# Altium schematic sheet 1700-0002_InterfaceBoard_RevA_1.SchDoc: 1700-0002_InterfaceBoard_RevA
size 897 x 589 mm; DRAWING_DATE: 4/15/2022; DRAWING_TITLE: PQI380 UNIV. INTERFACE BRD; PART_NUMBER: 7000-0303; REV: R12; Origin: Eagle; Date: 7/13/2023 2:16:40 PM; SheetNumber: 2; DWG-CO-NAME: DWG-CO-NAME; DWG-DATE: DWG-DATE; DWG-NUMBER: DWG-NUMBER; DWG-REV: DWG-REV; DWG-TITLE: DWG-TITLE; SIZE: SIZE; GateName_1: G$1; SymbolName_1: FRAME_D_L; LibraryName: frames; DeviceSetName: FRAME_D_L; Sheet: Sheet:
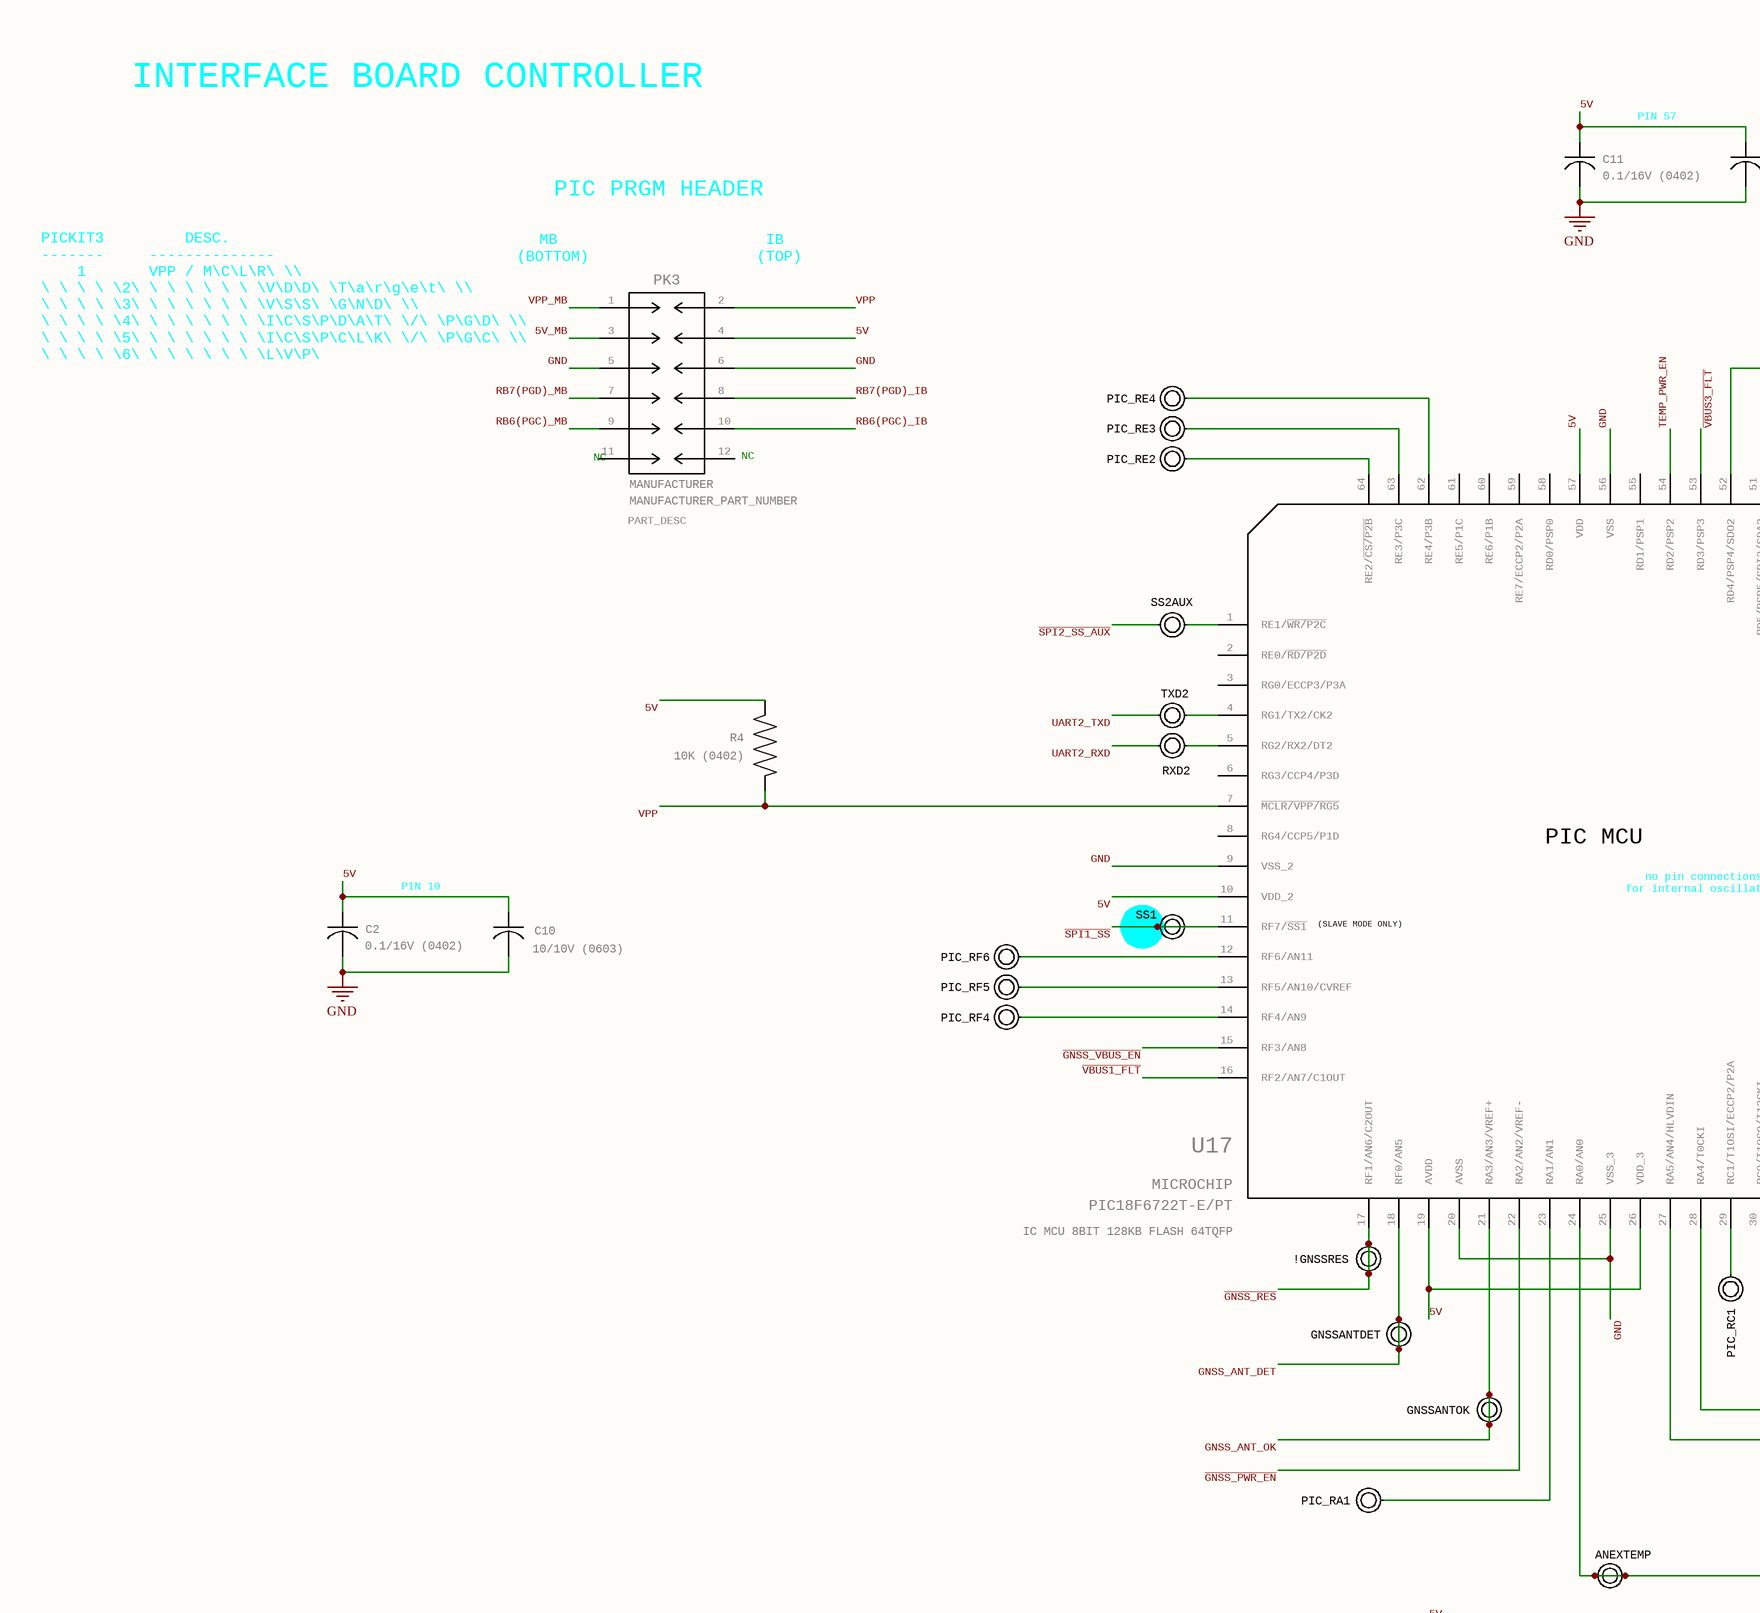
[diagram p0: 1700-0002_InterfaceBoard_RevA_1.SchDoc, top left]
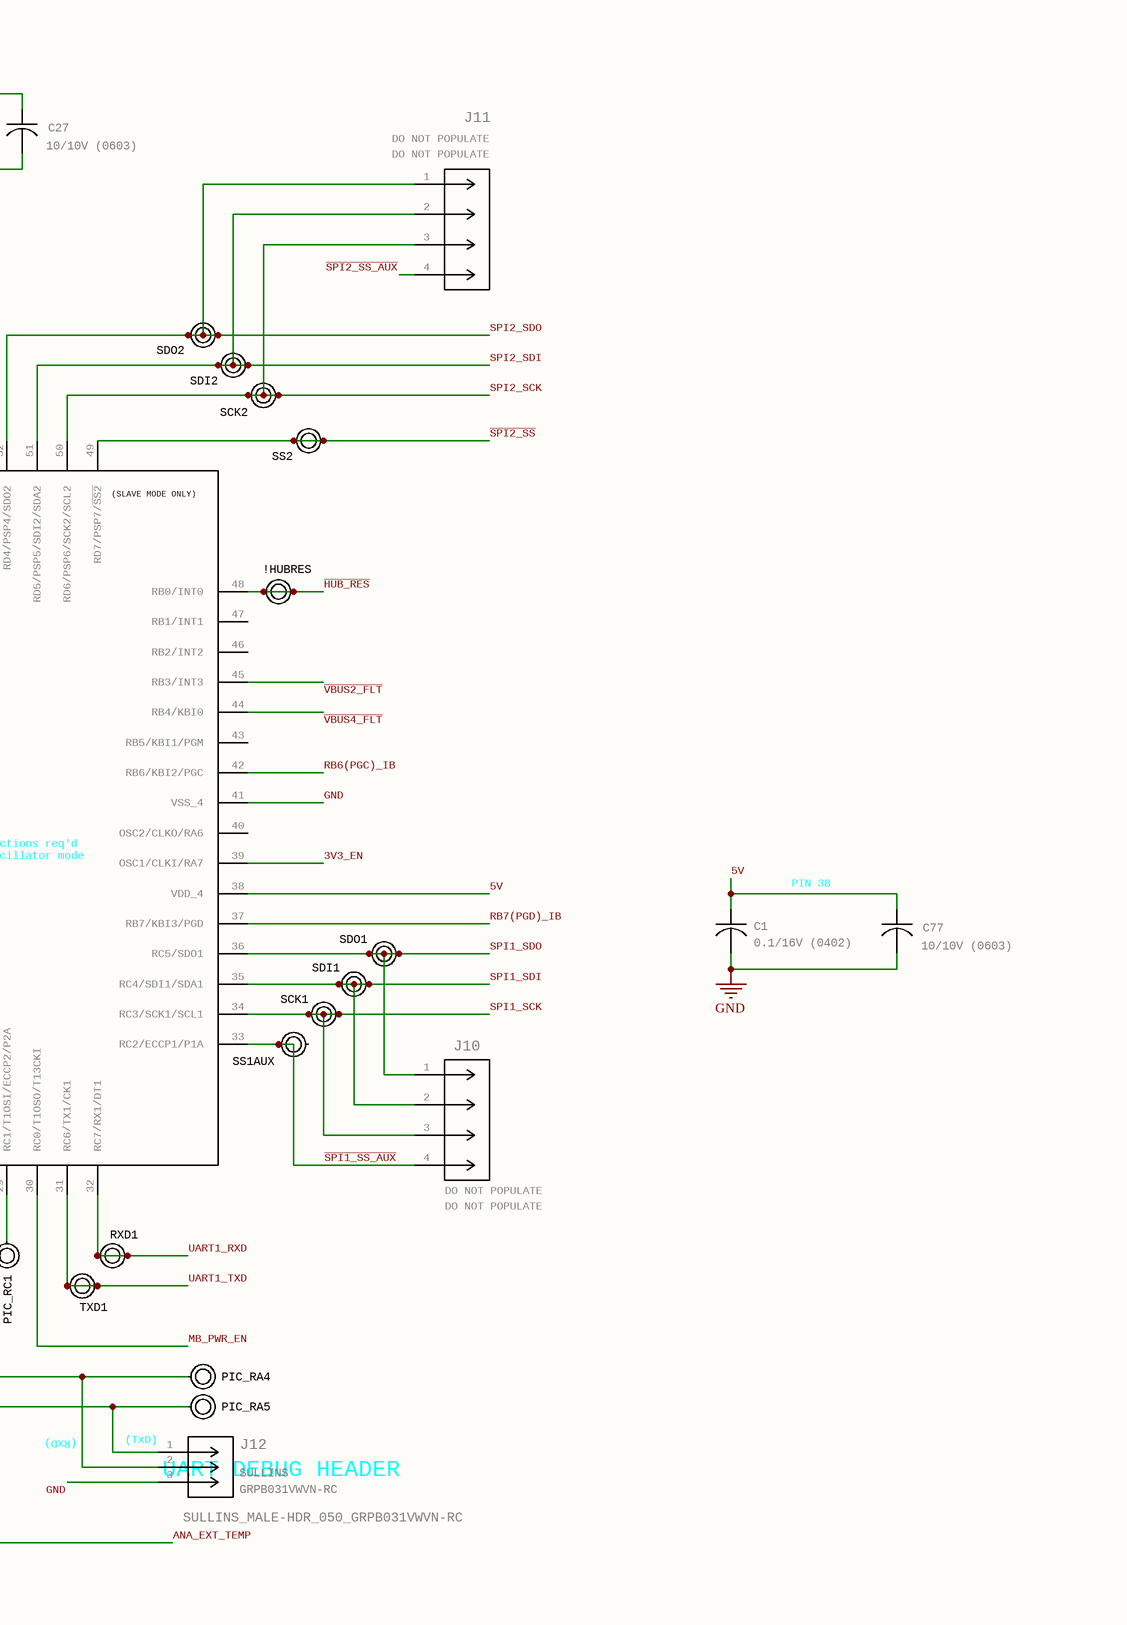
[diagram p1: 1700-0002_InterfaceBoard_RevA_1.SchDoc, top middle]
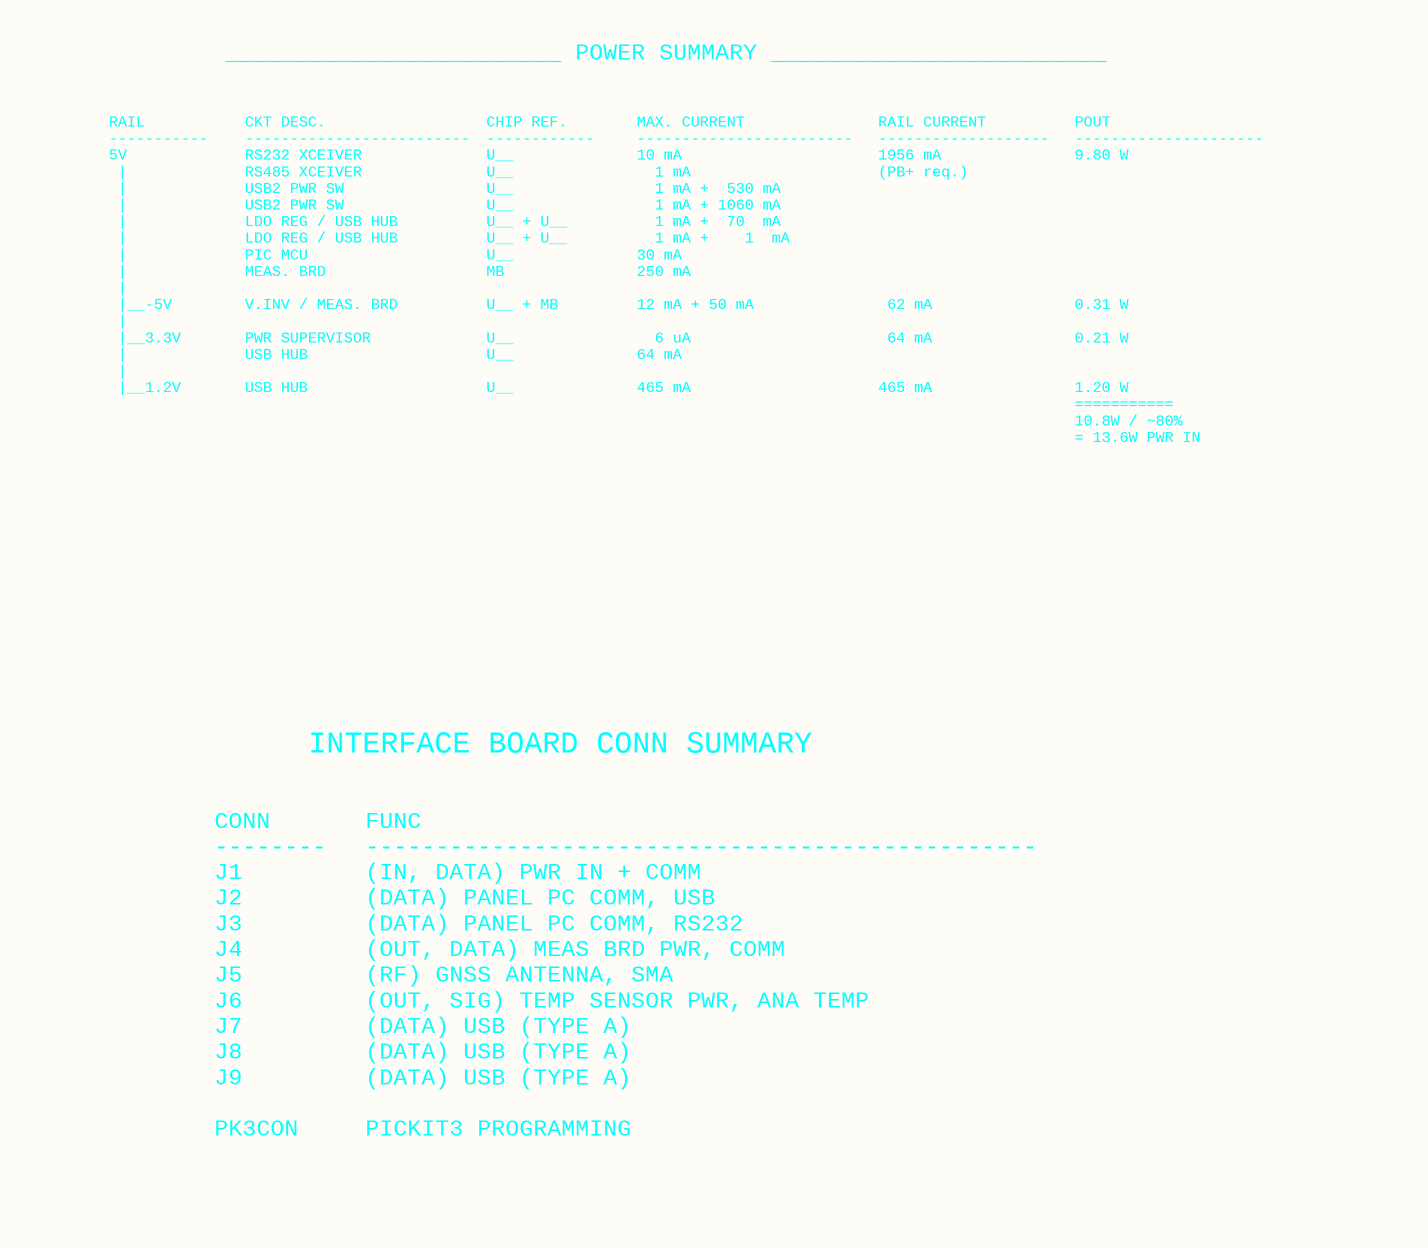
[diagram p2: 1700-0002_InterfaceBoard_RevA_1.SchDoc, top right]
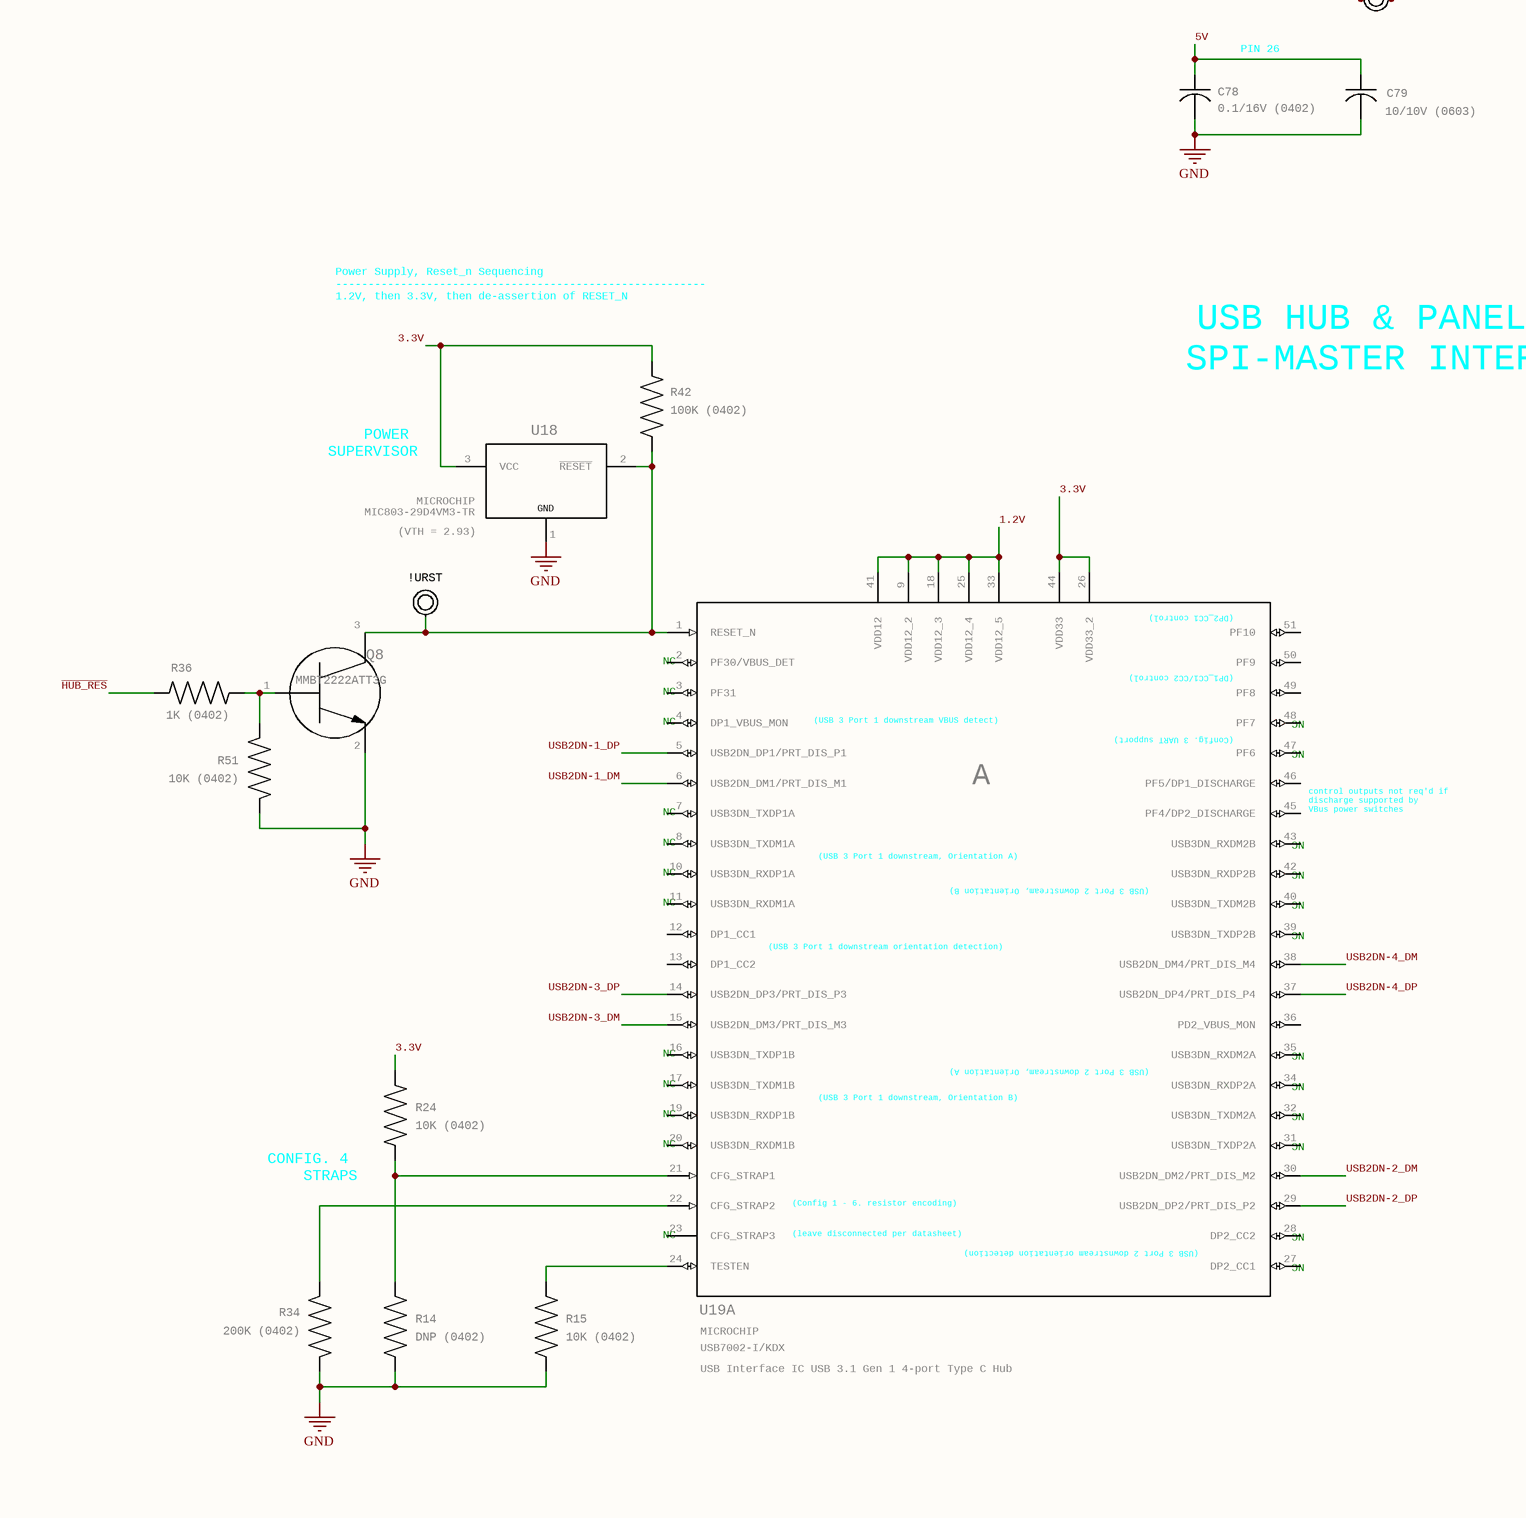
[diagram p3: 1700-0002_InterfaceBoard_RevA_1.SchDoc, bottom left]
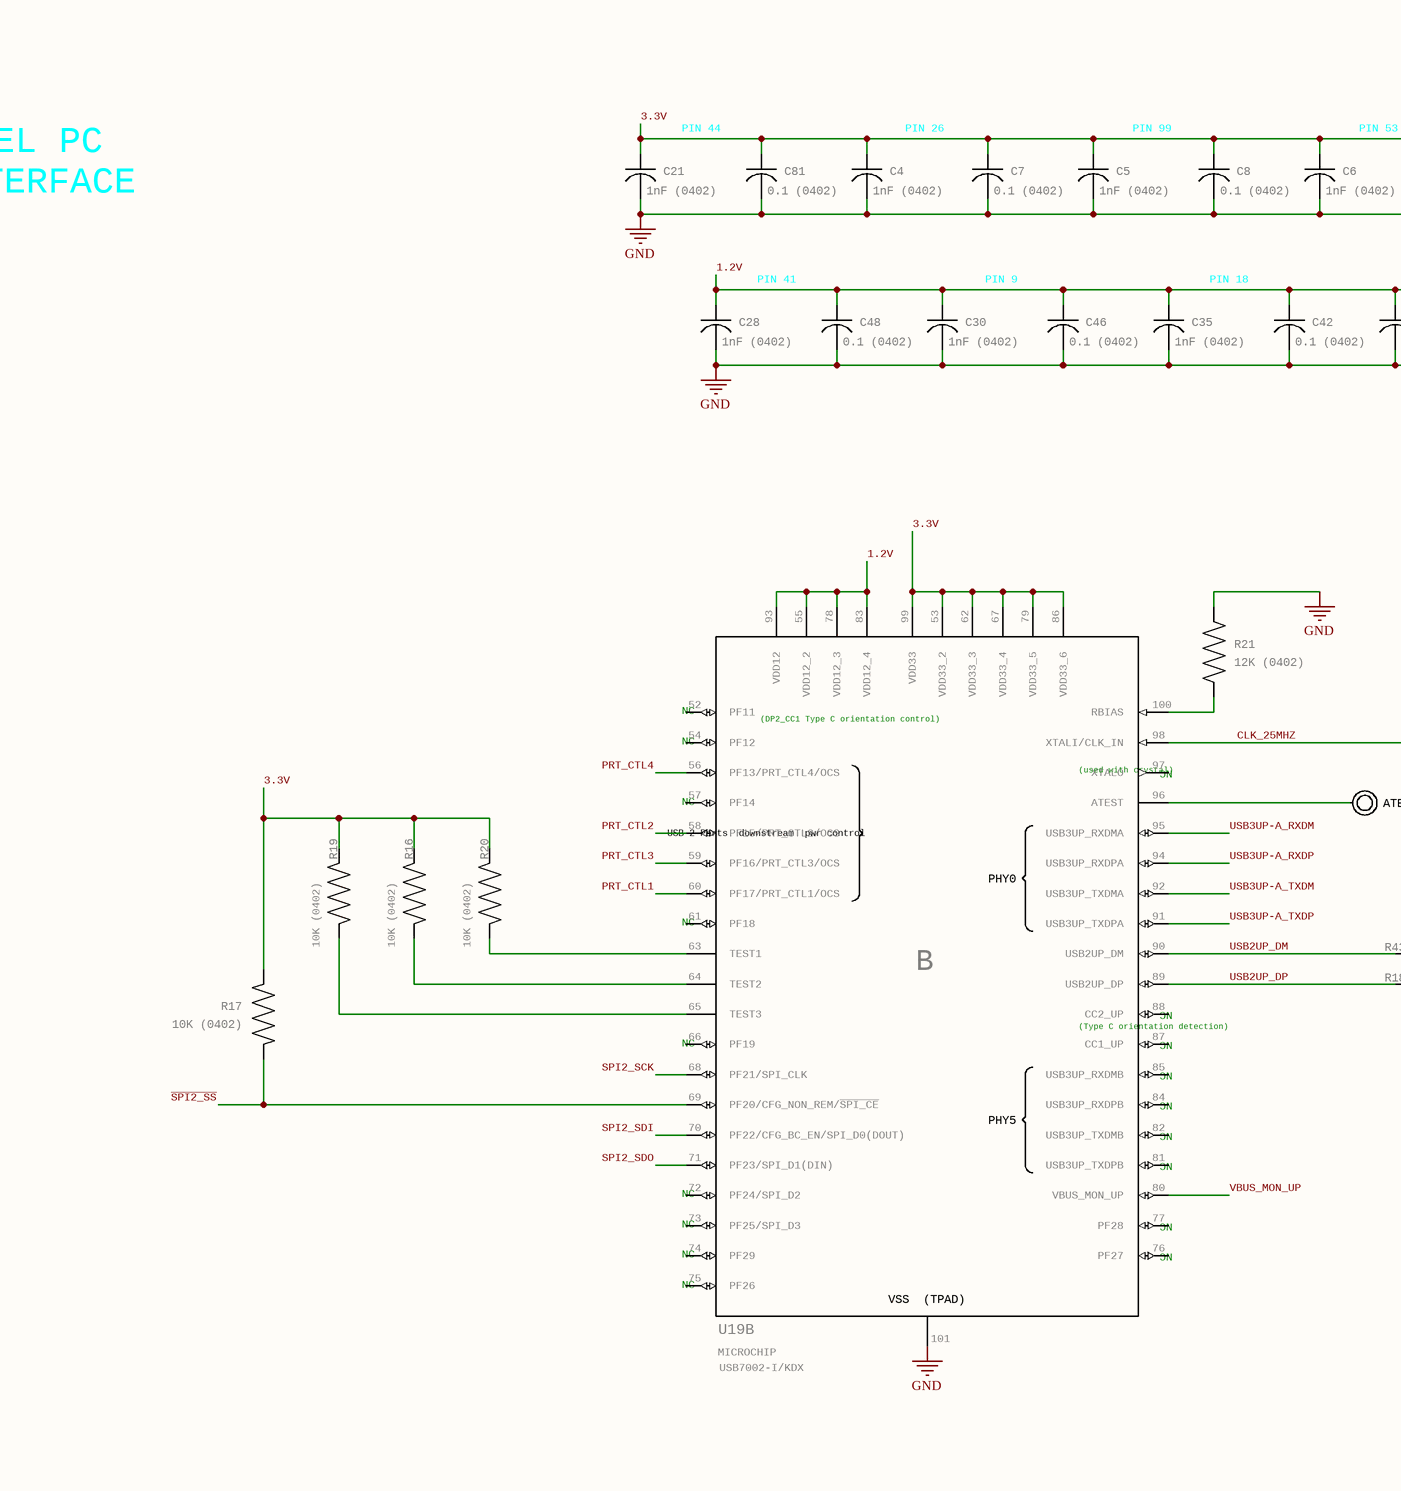
[diagram p4: 1700-0002_InterfaceBoard_RevA_1.SchDoc, bottom middle]
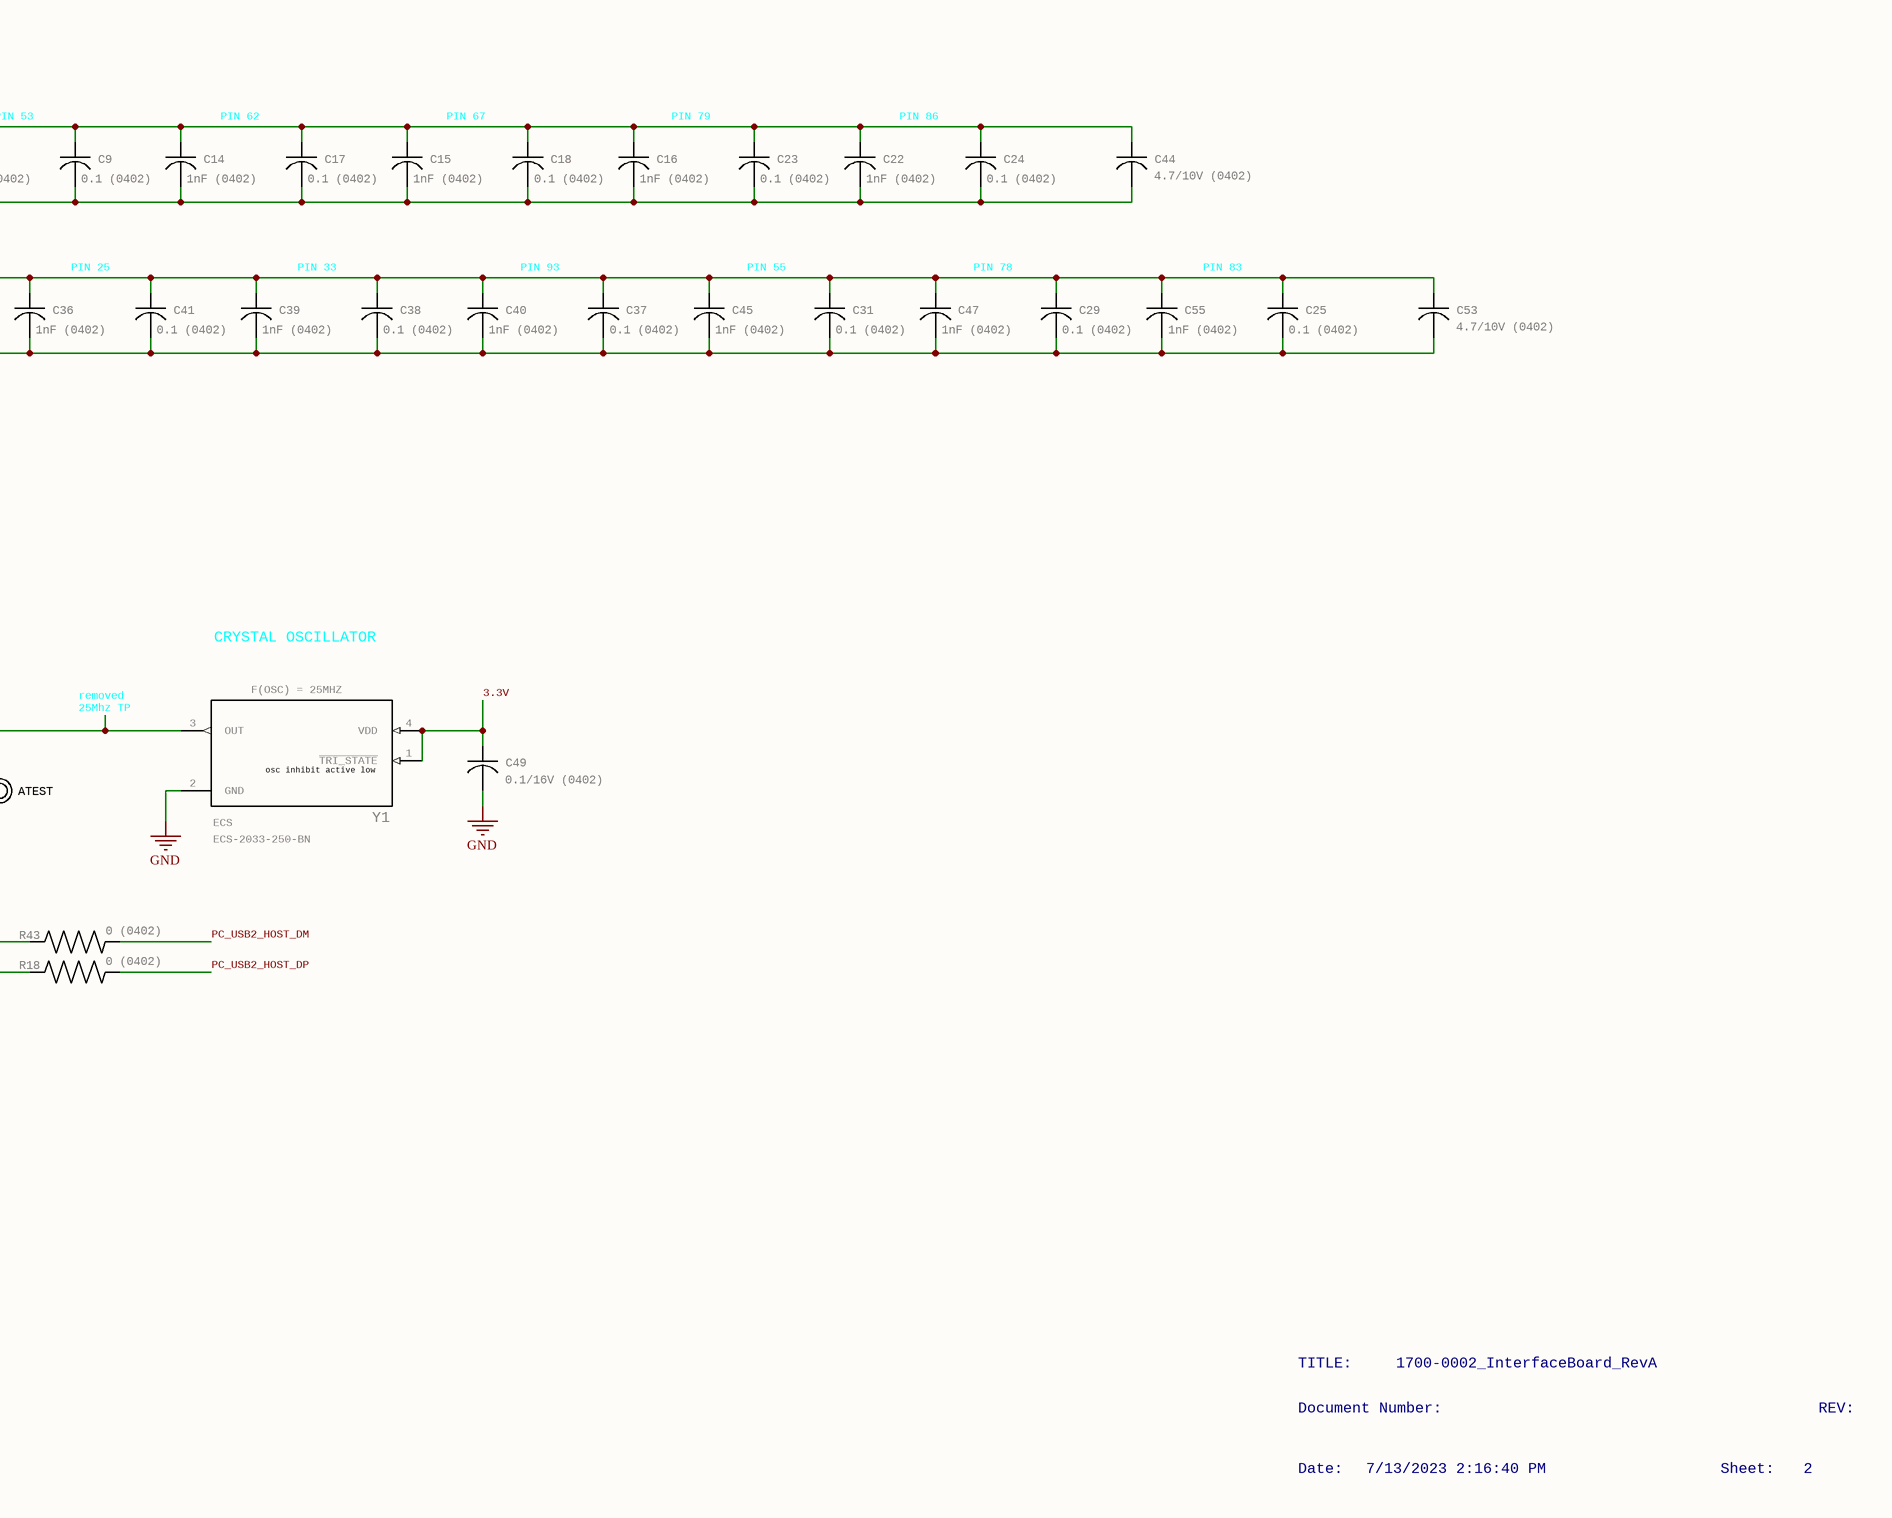
[diagram p5: 1700-0002_InterfaceBoard_RevA_1.SchDoc, bottom right]

## Parts
!GNSSRES  TST_POINT_PTH_20X40MIL_2PIN  [TST_POINT_PTH_20X40MIL_2PIN]  (value not drawn)
!HUBRES  TST_POINT_PTH_20X40MIL_2PIN  [TST_POINT_PTH_20X40MIL_2PIN]  (value not drawn)
!URST  TST_POINT_PTH_042-OCT  [TST_POINT_PTH_042-OCT]  (value not drawn)
ANEXTEMP  TST_POINT_PTH_20X40MIL_2PIN  [TST_POINT_PTH_20X40MIL_2PIN]  (value not drawn)
ATEST  TST_POINT_PTH_042-OCT  [TST_POINT_PTH_042-OCT]  (value not drawn)
C1  0.1/16V (0402)  [G-155_MUR]
C2  0.1/16V (0402)  [G-155_MUR]
C4  1nF (0402)  [G-155_MUR]
C5  1nF (0402)  [G-155_MUR]
C6  1nF (0402)  [G-155_MUR]
C7  0.1 (0402)  [G-155_MUR]
C8  0.1 (0402)  [G-155_MUR]
C9  0.1 (0402)  [G-155_MUR]
C10  10/10V (0603)  [CAP_C1608_TDK]
C11  0.1/16V (0402)  [G-155_MUR]
C14  1nF (0402)  [G-155_MUR]
C15  1nF (0402)  [G-155_MUR]
C16  1nF (0402)  [G-155_MUR]
C17  0.1 (0402)  [G-155_MUR]
C18  0.1 (0402)  [G-155_MUR]
C21  1nF (0402)  [G-155_MUR]
C22  1nF (0402)  [G-155_MUR]
C23  0.1 (0402)  [G-155_MUR]
C24  0.1 (0402)  [G-155_MUR]
C25  0.1 (0402)  [G-155_MUR]
C27  10/10V (0603)  [CAP_C1608_TDK]
C28  1nF (0402)  [G-155_MUR]
C29  0.1 (0402)  [G-155_MUR]
C30  1nF (0402)  [G-155_MUR]
C31  0.1 (0402)  [G-155_MUR]
C35  1nF (0402)  [G-155_MUR]
C36  1nF (0402)  [G-155_MUR]
C37  0.1 (0402)  [G-155_MUR]
C38  0.1 (0402)  [G-155_MUR]
C39  1nF (0402)  [G-155_MUR]
C40  1nF (0402)  [G-155_MUR]
C41  0.1 (0402)  [G-155_MUR]
C42  0.1 (0402)  [G-155_MUR]
C44  4.7/10V (0402)  [G-155_MUR]
C45  1nF (0402)  [G-155_MUR]
C46  0.1 (0402)  [G-155_MUR]
C47  1nF (0402)  [G-155_MUR]
C48  0.1 (0402)  [G-155_MUR]
C49  0.1/16V (0402)  [G-155_MUR]
C53  4.7/10V (0402)  [G-155_MUR]
C55  1nF (0402)  [G-155_MUR]
C77  10/10V (0603)  [CAP_C1608_TDK]
C78  0.1/16V (0402)  [G-155_MUR]
C79  10/10V (0603)  [CAP_C1608_TDK]
C81  0.1 (0402)  [G-155_MUR]
GNSSANTDET  TST_POINT_PTH_20X40MIL_2PIN  [TST_POINT_PTH_20X40MIL_2PIN]  (value not drawn)
GNSSANTOK  TST_POINT_PTH_20X40MIL_2PIN  [TST_POINT_PTH_20X40MIL_2PIN]  (value not drawn)
J10  MANUFACTURER: DO NOT POPULATE  [MOLEX_VERT-HDR_171861004]  (hidden comment: MOLEX_VERT-HDR_1718561004)
J11  MANUFACTURER: DO NOT POPULATE  [MOLEX_VERT-HDR_171861004]  (hidden comment: MOLEX_VERT-HDR_1718561004)
J12  SULLINS_MALE-HDR_050_GRPB031VWVN-RC  MANUFACTURER: SULLINS  MANUFACTURER_PART_NUMBER: GRPB031VWVN-RC  [CONN_GRPB031VWVN-RC_SUL]
PIC_RA1  TST_POINT_PTH_042-OCT  [TST_POINT_PTH_042-OCT]  (value not drawn)
PIC_RA4  TST_POINT_PTH_042-OCT  [TST_POINT_PTH_042-OCT]  (value not drawn)
PIC_RA5  TST_POINT_PTH_042-OCT  [TST_POINT_PTH_042-OCT]  (value not drawn)
PIC_RC1  TST_POINT_PTH_042-OCT  [TST_POINT_PTH_042-OCT]  (value not drawn)
PIC_RE2  TST_POINT_PTH_042-OCT  [TST_POINT_PTH_042-OCT]  (value not drawn)
PIC_RE3  TST_POINT_PTH_042-OCT  [TST_POINT_PTH_042-OCT]  (value not drawn)
PIC_RE4  TST_POINT_PTH_042-OCT  [TST_POINT_PTH_042-OCT]  (value not drawn)
PIC_RF4  TST_POINT_PTH_042-OCT  [TST_POINT_PTH_042-OCT]  (value not drawn)
PIC_RF5  TST_POINT_PTH_042-OCT  [TST_POINT_PTH_042-OCT]  (value not drawn)
PIC_RF6  TST_POINT_PTH_042-OCT  [TST_POINT_PTH_042-OCT]  (value not drawn)
PK3  CON_MOLEX_901311086  [CON_901311086_MOL]  (value not drawn)
Q8  MMBT2222ATT3G  [SC-75(SOT-416)_ONSEMI]
R4  10K (0402)  [RESC1005X35N]
R14  DNP (0402)  [RESC1005X35N]
R15  10K (0402)  [RESC1005X35N]
R16  10K (0402)  [RESC1005X35N]
R17  10K (0402)  [RESC1005X35N]
R18  0 (0402)  [RESC1005X35N]
R19  10K (0402)  [RESC1005X35N]
R20  10K (0402)  [RESC1005X35N]
R21  12K (0402)  [RESC1005X35N]
R24  10K (0402)  [RESC1005X35N]
R34  200K (0402)  [RESC1005X35N]
R36  1K (0402)  [RESC1005X35N]
R42  100K (0402)  [RESC1005X35N]
R43  0 (0402)  [RESC1005X35N]
R51  10K (0402)  [RESC1005X35N]
RXD1  TST_POINT_PTH_20X40MIL_2PIN  [TST_POINT_PTH_20X40MIL_2PIN]  (value not drawn)
RXD2  TST_POINT_PTH_20X40MIL_2PIN  [TST_POINT_PTH_20X40MIL_2PIN]  (value not drawn)
SCK1  TST_POINT_PTH_20X40MIL_2PIN  [TST_POINT_PTH_20X40MIL_2PIN]  (value not drawn)
SCK2  TST_POINT_PTH_20X40MIL_2PIN  [TST_POINT_PTH_20X40MIL_2PIN]  (value not drawn)
SDI1  TST_POINT_PTH_20X40MIL_2PIN  [TST_POINT_PTH_20X40MIL_2PIN]  (value not drawn)
SDI2  TST_POINT_PTH_20X40MIL_2PIN  [TST_POINT_PTH_20X40MIL_2PIN]  (value not drawn)
SDO1  TST_POINT_PTH_20X40MIL_2PIN  [TST_POINT_PTH_20X40MIL_2PIN]  (value not drawn)
SDO2  TST_POINT_PTH_20X40MIL_2PIN  [TST_POINT_PTH_20X40MIL_2PIN]  (value not drawn)
SS1  TST_POINT_PTH_20X40MIL_2PIN  [TST_POINT_PTH_20X40MIL_2PIN]  (value not drawn)
SS1AUX  TST_POINT_PTH_20X40MIL_2PIN  [TST_POINT_PTH_20X40MIL_2PIN]  (value not drawn)
SS2  TST_POINT_PTH_20X40MIL_2PIN  [TST_POINT_PTH_20X40MIL_2PIN]  (value not drawn)
SS2AUX  TST_POINT_PTH_20X40MIL_2PIN  [TST_POINT_PTH_20X40MIL_2PIN]  (value not drawn)
TXD1  TST_POINT_PTH_20X40MIL_2PIN  [TST_POINT_PTH_20X40MIL_2PIN]  (value not drawn)
TXD2  TST_POINT_PTH_20X40MIL_2PIN  [TST_POINT_PTH_20X40MIL_2PIN]  (value not drawn)
U17  PICMCU: PIC MCU  (SLAVEMODEONLY): (SLAVE MODE ONLY)  MANUFACTURER: MICROCHIP  MANUFACTURER_PART_NUMBER: PIC18F6722T-E/PT  PART_DESC: IC MCU 8BIT 128KB FLASH 64TQFP  [TQFP64_10X10MC_MCH]  (hidden comment: PIC18F6627T-E/PT)
U18  (VTH = 2.93)  MANUFACTURER: MICROCHIP  MANUFACTURER_PART_NUMBER: MIC803-29D4VM3-TR  [SOT-23_M3_MCH]
U19  MANUFACTURER: MICROCHIP  MANUFACTURER_PART_NUMBER: USB7002-I/KDX  PART_DESC: USB Interface IC USB 3.1 Gen 1 4-port Type C Hub  [VQFN100_KDX_MCH]  (hidden comment: MICROCHIP_USB7002-I/KDX)  (parts A,B of 2)
Y1  F(OSC) = 25MHZ  oscinhibitactivelow: osc inhibit active low  MANUFACTURER: ECS  MANUFACTURER_PART_NUMBER: ECS-2033-250-BN  [OSC_ECS-2033-250-BN]

## Nets
GND: C1.2 C2.2 C4.2 C5.2 C6.2 C7.2 C8.2 C9.2 C10.2 C11.2 C14.2 C15.2 C16.2 C17.2 C18.2 C21.2 C22.2 C23.2 C24.2 C25.2 C27.2 C28.2 C29.2 C30.2 C31.2 C35.2 C36.2 C37.2 C38.2 C39.2 C40.2 C41.2 C42.2 C44.2 C45.2 C46.2 C47.2 C48.2 C49.2 C53.2 C55.2 C77.2 C78.2 C79.2 C81.2 J12.3 PK3.5 PK3.6 Q8.2(E) R14.2 R15.2 R21.1 R34.2 R51.2 U17.9(VSS_2) U17.20(AVSS) U17.25(VSS_3) U17.41(VSS_4) U17.56(VSS) U18.1(GND) U19.101(VSS) Y1.2(GND)
1.2V: C25.1 C28.1 C29.1 C30.1 C31.1 C35.1 C36.1 C37.1 C38.1 C39.1 C40.1 C41.1 C42.1 C45.1 C46.1 C47.1 C48.1 C53.1 C55.1 U19.9(VDD12_2) U19.18(VDD12_3) U19.25(VDD12_4) U19.33(VDD12_5) U19.41(VDD12) U19.55(VDD12_2) U19.78(VDD12_3) U19.83(VDD12_4) U19.93(VDD12)
3.3V: C4.1 C5.1 C6.1 C7.1 C8.1 C9.1 C14.1 C15.1 C16.1 C17.1 C18.1 C21.1 C22.1 C23.1 C24.1 C44.1 C49.1 C81.1 R16.1 R17.1 R19.1 R20.1 R24.1 R42.1 U18.3(VCC) U19.26(VDD33_2) U19.44(VDD33) U19.53(VDD33_2) U19.62(VDD33_3) U19.67(VDD33_4) U19.79(VDD33_5) U19.86(VDD33_6) U19.99(VDD33) Y1.1(~{TRI_STATE}) Y1.4(VDD)
3V3_EN: U17.39(OSC1/CLKI/RA7)
5V: C1.1 C2.1 C10.1 C11.1 C27.1 C77.1 C78.1 C79.1 PK3.4 R4.1 U17.10(VDD_2) U17.19(AVDD) U17.26(VDD_3) U17.38(VDD_4) U17.57(VDD)
5V_MB: PK3.3
ANA_EXT_TEMP: ANEXTEMP.P$1 ANEXTEMP.P$2 U17.24(RA0/AN0)
CLK_25MHZ: U19.98(XTALI/CLK_IN) Y1.3(OUT)
~{GNSS_PWR_EN}: U17.22(RA2/AN2/VREF-)
~{GNSS_RES}: !GNSSRES.P$1 !GNSSRES.P$2 U17.17(RF1/AN6/C2OUT)
~{GNSS_VBUS_EN}: U17.15(RF3/AN8)
GNSS_ANT_DET: GNSSANTDET.P$1 GNSSANTDET.P$2 U17.18(RF0/AN5)
GNSS_ANT_OK: GNSSANTOK.P$1 GNSSANTOK.P$2 U17.21(RA3/AN3/VREF+)
~{HUB_RES}: !HUBRES.P$1 !HUBRES.P$2 R36.1 U17.48(RB0/INT0)
MB_PWR_EN: U17.30(RC0/T1OSO/T13CKI)
PC_USB2_HOST_DM: R43.2
PC_USB2_HOST_DP: R18.2
PRT_CTL1: U19.60(PF17/PRT_CTL1/OCS)
PRT_CTL2: U19.58(PF15/PRT_CTL2/OCS)
PRT_CTL3: U19.59(PF16/PRT_CTL3/OCS)
PRT_CTL4: U19.56(PF13/PRT_CTL4/OCS)
RB6(PGC)_IB: PK3.10 U17.42(RB6/KBI2/PGC)
RB6(PGC)_MB: PK3.9
RB7(PGD)_IB: PK3.8 U17.37(RB7/KBI3/PGD)
RB7(PGD)_MB: PK3.7
~{SPI1_SS}: SS1.P$1 SS1.P$2 U17.11(RF7/~{SS1})
~{SPI1_SS_AUX}: J10.4 SS1AUX.P$2 U17.33(RC2/ECCP1/P1A)
~{SPI2_SS}: R17.2 SS2.P$1 SS2.P$2 U17.49(RD7/PSP7/~{SS2}) U19.69(PF20/CFG_NON_REM/~{SPI_CE})
~{SPI2_SS_AUX}: J11.4 SS2AUX.P$2
SPI1_SCK: J10.3 SCK1.P$1 SCK1.P$2 U17.34(RC3/SCK1/SCL1)
SPI1_SDI: J10.2 SDI1.P$1 SDI1.P$2 U17.35(RC4/SDI1/SDA1)
SPI1_SDO: J10.1 SDO1.P$1 SDO1.P$2 U17.36(RC5/SDO1)
SPI2_SCK: J11.3 SCK2.P$1 SCK2.P$2 U17.50(RD6/PSP6/SCK2/SCL2) U19.68(PF21/SPI_CLK)
SPI2_SDI: J11.2 SDI2.P$1 SDI2.P$2 U17.51(RD5/PSP5/SDI2/SDA2) U19.70(PF22/CFG_BC_EN/SPI_D0(DOUT))
SPI2_SDO: J11.1 SDO2.P$1 SDO2.P$2 U17.52(RD4/PSP4/SDO2) U19.71(PF23/SPI_D1(DIN))
TEMP_PWR_EN: U17.54(RD2/PSP2)
UART1_RXD: RXD1.P$1 RXD1.P$2 U17.32(RC7/RX1/DT1)
UART1_TXD: TXD1.P$1 TXD1.P$2 U17.31(RC6/TX1/CK1)
UART2_RXD: RXD2.P$2
UART2_TXD: TXD2.P$2
USB2DN-1_DM: U19.6(USB2DN_DM1/PRT_DIS_M1)
USB2DN-1_DP: U19.5(USB2DN_DP1/PRT_DIS_P1)
USB2DN-2_DM: U19.30(USB2DN_DM2/PRT_DIS_M2)
USB2DN-2_DP: U19.29(USB2DN_DP2/PRT_DIS_P2)
USB2DN-3_DM: U19.15(USB2DN_DM3/PRT_DIS_M3)
USB2DN-3_DP: U19.14(USB2DN_DP3/PRT_DIS_P3)
USB2DN-4_DM: U19.38(USB2DN_DM4/PRT_DIS_M4)
USB2DN-4_DP: U19.37(USB2DN_DP4/PRT_DIS_P4)
USB2UP_DM: R43.1 U19.90(USB2UP_DM)
USB2UP_DP: R18.1 U19.89(USB2UP_DP)
USB3UP-A_RXDM: U19.95(USB3UP_RXDMA)
USB3UP-A_RXDP: U19.94(USB3UP_RXDPA)
USB3UP-A_TXDM: U19.92(USB3UP_TXDMA)
USB3UP-A_TXDP: U19.91(USB3UP_TXDPA)
~{VBUS1_FLT}: U17.16(RF2/AN7/C1OUT)
~{VBUS2_FLT}: U17.45(RB3/INT3)
~{VBUS3_FLT}: U17.53(RD3/PSP3)
~{VBUS4_FLT}: U17.44(RB4/KBI0)
VBUS_MON_UP: U19.80(VBUS_MON_UP)
VPP: PK3.2 R4.2 U17.7(~{MCLR/VPP/RG5})
VPP_MB: PK3.1
Net!URST_P$1: !URST.P$1 Q8.3(C) R42.2 U18.2(~{RESET}) U19.1(RESET_N)
NetATEST_P$1: ATEST.P$1 U19.96(ATEST)
NetJ12_1: J12.1 PIC_RA5.P$1 U17.27(RA5/AN4/HLVDIN)
NetJ12_2: J12.2 PIC_RA4.P$1 U17.28(RA4/T0CKI)
NetPIC_RA1_P$1: PIC_RA1.P$1 U17.23(RA1/AN1)
NetPIC_RC1_P$1: PIC_RC1.P$1 U17.29(RC1/T1OSI/ECCP2/P2A)
NetPIC_RE2_P$1: PIC_RE2.P$1 U17.64(RE2/~{CS/P2B})
NetPIC_RE3_P$1: PIC_RE3.P$1 U17.63(RE3/P3C)
NetPIC_RE4_P$1: PIC_RE4.P$1 U17.62(RE4/P3B)
NetPIC_RF4_P$1: PIC_RF4.P$1 U17.14(RF4/AN9)
NetPIC_RF5_P$1: PIC_RF5.P$1 U17.13(RF5/AN10/CVREF)
NetPIC_RF6_P$1: PIC_RF6.P$1 U17.12(RF6/AN11)
NetQ8_1: Q8.1(B) R36.2 R51.1
NetR14_1: R14.1 R24.2 U19.21(CFG_STRAP1)
NetR15_1: R15.1 U19.24(TESTEN)
NetR16_2: R16.2 U19.64(TEST2)
NetR19_2: R19.2 U19.65(TEST3)
NetR20_2: R20.2 U19.63(TEST1)
NetR21_2: R21.2 U19.100(RBIAS)
NetR34_1: R34.1 U19.22(CFG_STRAP2)
NetRXD2_P$1: RXD2.P$1 U17.5(RG2/RX2/DT2)
NetSS2AUX_P$1: SS2AUX.P$1 U17.1(RE1/~{WR/P2C})
NetTXD2_P$1: TXD2.P$1 U17.4(RG1/TX2/CK2)

Not connected (* = marked no-connect by the designer): PK3 11 12; SS1AUX P$1; U17 2(RE0/~{RD/P2D}) 3(RG0/ECCP3/P3A) 6(RG3/CCP4/P3D) 8(RG4/CCP5/P1D) 40(OSC2/CLKO/RA6) 43(RB5/KBI1/PGM) 46(RB2/INT2) 47(RB1/INT1) 55(RD1/PSP1) 58(RD0/PSP0) 59(RE7/ECCP2/P2A) 60(RE6/P1B) 61(RE5/P1C); U19 2(PF30/VBUS_DET) 3(PF31) 4(DP1_VBUS_MON) 7(USB3DN_TXDP1A) 8(USB3DN_TXDM1A) 10(USB3DN_RXDP1A) 11(USB3DN_RXDM1A) 12(DP1_CC1) 13(DP1_CC2) 16(USB3DN_TXDP1B) 17(USB3DN_TXDM1B) 19(USB3DN_RXDP1B) 20(USB3DN_RXDM1B) 23(CFG_STRAP3) 27(DP2_CC1) 28(DP2_CC2) 31(USB3DN_TXDP2A) 32(USB3DN_TXDM2A) 34(USB3DN_RXDP2A) 35(USB3DN_RXDM2A) 36(PD2_VBUS_MON) 39(USB3DN_TXDP2B) 40(USB3DN_TXDM2B) 42(USB3DN_RXDP2B) 43(USB3DN_RXDM2B) 45(PF4/DP2_DISCHARGE) 46(PF5/DP1_DISCHARGE) 47(PF6) 48(PF7) 49(PF8) 50(PF9) 51(PF10) 52(PF11) 54(PF12) 57(PF14) 61(PF18) 66(PF19) 72(PF24/SPI_D2) 73(PF25/SPI_D3) 74(PF29) 75(PF26) 76(PF27) 77(PF28) 81(USB3UP_TXDPB) 82(USB3UP_TXDMB) 84(USB3UP_RXDPB) 85(USB3UP_RXDMB) 87(CC1_UP) 88(CC2_UP) 97(XTALO)

## Notes on the sheet
- ________________________ POWER SUMMARY ________________________
- INTERFACE BOARD CONTROLLER
- PIN 57
- PIC PRGM HEADER
- (near PK3) MB
  (BOTTOM)
- IB
  (TOP)
- RAIL
  -----------
  5V
  |
  |
  |
  |
  |
  |
  |
  |
  |__-5V
  |
  |__3.3V
  |
  |
  |__1.2V
- CKT DESC.
  -------------------------
  RS232 XCEIVER
  RS485 XCEIVER
  USB2 PWR SW
  USB2 PWR SW
  LDO REG / USB HUB
  LDO REG / USB HUB
  PIC MCU
  MEAS. BRD
  V.INV / MEAS. BRD
  PWR SUPERVISOR
  USB HUB
  USB HUB
- CHIP REF.
  ------------
  U__
  U__
  U__
  U__
  U__ + U__
  U__ + U__
  U__
  MB
  U__ + MB
  U__
  U__
  U__
- MAX. CURRENT
  ------------------------
  10 mA
  1 mA
  1 mA +  530 mA
  1 mA + 1060 mA
  1 mA +  70  mA
  1 mA +    1  mA
  30 mA
  250 mA
  12 mA + 50 mA
  6 uA
  64 mA
  465 mA
- RAIL CURRENT
  -------------------
  1956 mA
  (PB+ req.)
  62 mA
  64 mA
  465 mA
- (near PK3) PICKIT3         DESC.
  -------     --------------
  1       VPP / M\C\L\R\ \\
  \ \ \ \ \2\ \ \ \ \ \ \ \V\D\D\ \T\a\r\g\e\t\ \\
  \ \ \ \ \3\ \ \ \ \ \ \ \V\S\S\ \G\N\D\ \\
  \ \ \ \ \4\ \ \ \ \ \ \ \I\C\S\P\D\A\T\ \/\ \P\G\D\ \\
  \ \ \ \ \5\ \ \ \ \ \ \ \I\C\S\P\C\L\K\ \/\ \P\G\C\ \\
  \ \ \ \ \6\ \ \ \ \ \ \ \L\V\P\
- (near PK3) NC
- POUT
  ---------------------
  9.80 W
  0.31 W
  0.21 W
  1.20 W
  ===========
  10.8W / ~80%
  = 13.6W PWR IN
- INTERFACE BOARD CONN SUMMARY
- PIN 10
- (near U17) no pin connections req'd
  for internal oscillator mode
- PIN 38
- CONN
  --------
  J1
  J2
  J3
  J4
  J5
  J6
  J7
  J8
  J9
  PK3CON
- FUNC
  ------------------------------------------------
  (IN, DATA) PWR IN + COMM
  (DATA) PANEL PC COMM, USB
  (DATA) PANEL PC COMM, RS232
  (OUT, DATA) MEAS BRD PWR, COMM
  (RF) GNSS ANTENNA, SMA
  (OUT, SIG) TEMP SENSOR PWR, ANA TEMP
  (DATA) USB (TYPE A)
  (DATA) USB (TYPE A)
  (DATA) USB (TYPE A)
  PICKIT3 PROGRAMMING
- (RxD)
- (TxD)
- UART DEBUG HEADER
- (near C78) PIN 26
- Power Supply, Reset_n Sequencing
  ---------------------------------------------------------
  1.2V, then 3.3V, then de-assertion of RESET_N
- PIN 44
- PIN 26
- PIN 99
- PIN 53
- PIN 62
- PIN 67
- PIN 79
- PIN 86
- USB HUB & PANEL PC
  SPI-MASTER INTERFACE
- POWER
  SUPERVISOR
- PIN 41
- PIN 9
- PIN 18
- PIN 25
- PIN 33
- PIN 93
- PIN 55
- PIN 78
- PIN 83
- (near U19) (DP2_CC1 control)
- (near U19) NC
- (near U19) (DP1_CC1/CC2 control)
- (near U19) (USB 3 Port 1 downstream VBUS detect)
- (near U19) (Config. 3 UART support)
- (near U19) control outputs not req'd if
  discharge supported by
  VBus power switches
- CRYSTAL OSCILLATOR
- (near U19) (USB 3 Port 1 downstream, Orientation A)
- (near U19) (USB 3 Port 2 downstream, Orientation B)
- (near U19) (DP2_CC1 Type C orientation control)
- removed
  25Mhz TP
- (near U19) (USB 3 Port 1 downstream orientation detection)
- (near U19) (used with crystal)
- (near U19) (USB 3 Port 2 downstream, Orientation A)
- (near U19) (USB 3 Port 1 downstream, Orientation B)
- (near R24) CONFIG. 4
  STRAPS
- (near U19) (Config 1 - 6. resistor encoding)
- (near U19) (Type C orientation detection)
- (near U19) (leave disconnected per datasheet)
- (near U19) (USB 3 Port 2 downstream orientation detection)
- TITLE:
- Document Number:
- 1700-0002_InterfaceBoard_RevA
- REV:
- Date:
- 7/13/2023 2:16:40 PM
- Sheet:
- 2

## Library data of the parts
!GNSSRES !HUBRES ANEXTEMP GNSSANTDET GNSSANTOK RXD1 RXD2 SCK1 SCK2 SDI1 SDI2 SDO1 SDO2 SS1 SS1AUX SS2 SS2AUX TXD1 TXD2 = TST_POINT_PTH_20X40MIL_2PIN: PART_DESC: PCB FEATURE, TEST POINT, ID 20MIL, OD 40MIL; GateName_1: G$1; SymbolName_1: TST_POINT_PTH_042-OCT-2PIN; LibraryName: TTECH; DeviceSetName: TST_POINT_PTH_20X40MIL_2PIN
!URST ATEST PIC_RA1 PIC_RA4 PIC_RA5 PIC_RC1 PIC_RE2-PIC_RE4 PIC_RF4-PIC_RF6 = TST_POINT_PTH_042-OCT: PART_DESC: PCB feature, test point, ID 42mil, OD 72mil; GateName_1: G$1; SymbolName_1: TST_POINT_PTH_042-OCT; LibraryName: TTECH; DeviceSetName: TST_POINT_PTH_042-OCT
C1 C2 C7-C9 C11 C17 C18 C23-C25 C29 C31 C37 C38 C41 C42 C46 C48 C49 C78 C81 = CAP_CER_0402_MURATA: MANUFACTURER: MURATA; MANUFACTURER_PART_NUMBER: GCM155R71C104KA55D; PART_DESC: CAP CER 0.1UF 16V X7R 0402; GateName_1: A; SymbolName_1: CAPH; LibraryName: TTECH; DeviceSetName: CAP_CER_0402_MURATA
C4-C6 C14-C16 C21 C22 C28 C30 C35 C36 C39 C40 C45 C47 C55 = CAP_CER_0402_MURATA: MANUFACTURER: MURATA; MANUFACTURER_PART_NUMBER: C0402C102K4RAC7867; PART_DESC: CAP CER 1000PF 16V X7R 0402; GateName_1: A; SymbolName_1: CAPH; LibraryName: TTECH; DeviceSetName: CAP_CER_0402_MURATA
C10 C27 C77 C79 = CAP_CER_0603_TDK: MANUFACTURER: MURATA; MANUFACTURER_PART_NUMBER: GRM188D71A106KA73D; PART_DESC: CAP CER 10UF 10V X7T 0603; GateName_1: A; SymbolName_1: CAPH; LibraryName: TTECH; DeviceSetName: CAP_CER_0603_TDK
C44 C53 = CAP_CER_0402_MURATA: MANUFACTURER: MURATA; MANUFACTURER_PART_NUMBER: C1005X5R1A475K050BE; PART_DESC: CAP CER 4.7UF 10V X5R 0402; GateName_1: A; SymbolName_1: CAPH; LibraryName: TTECH; DeviceSetName: CAP_CER_0402_MURATA
J10 J11 = MOLEX_VERT-HDR_1718561004: PART_DESC: (Molex 1718561004) CONN HEADER VERT 4POS 2.54MM; GateName_1: A; SymbolName_1: MOLEX_HEADER_1718561004; LibraryName: TTECH; DeviceSetName: MOLEX_VERT-HDR_1718561004; MANUFACTURER_PART_NUMBER: DO NOT POPULATE
J12 = SULLINS_MALE-HDR_050_GRPB031VWVN-RC: PART_DESC: CONN HEADER VERT 3POS 1.27MM; GateName_1: A; SymbolName_1: CONN_03P_00C_1; LibraryName: TTECH; DeviceSetName: SULLINS_MALE-HDR_050_GRPB031VWVN-RC
PK3 = CON_MOLEX_901311086: GateName_1: A; SymbolName_1: CON_901311086; LibraryName: TTECH; DeviceSetName: CON_MOLEX_901311086; MANUFACTURER: MANUFACTURER; MANUFACTURER_PART_NUMBER: MANUFACTURER_PART_NUMBER; PART_DESC: PART_DESC
Q8 = MMBT2222ATT3G: MANUFACTURER: ONSEMI; PART_DESC: TRANS NPN 40V 0.6A SC75 SOT416; GateName_1: A; DESCRIPTION: Transistor, gen purpose, NPN; SymbolName_1: MMBT2222ATT3G; LibraryName: TTECH; DeviceSetName: MMBT2222ATT3G; MANUFACTURER_PART_NUMBER: MMBT2222ATT3G
R4 R15-R17 R19 R20 R24 R51 = RES_0402_VISHAY: RES SMD ... 0402; MANUFACTURER: VISHAY; PART_DESC: RES 10K OHM 1% 1/16W 0402; GateName_1: G$1; SymbolName_1: CRCW040210K0FKEDC; LibraryName: TTECH; DeviceSetName: RES_0402_VISHAY; MANUFACTURER_PART_NUMBER: CRCW040210K0FKEDC
R14 = RES_0402_VISHAY: RES SMD ... 0402; MANUFACTURER: DO NOT POPULATE; GateName_1: G$1; SymbolName_1: CRCW040210K0FKEDC; LibraryName: TTECH; DeviceSetName: RES_0402_VISHAY; MANUFACTURER_PART_NUMBER: DO NOT POPULATE; PART_DESC: DNP (0402)
R18 R43 = RES_0402_VISHAY: RES SMD ... 0402; MANUFACTURER: VISHAY; MANUFACTURER_PART_NUMBER: CRCW04020000Z0EDC; PART_DESC: RES 0 OHM JUMPER 1/16W 0402; GateName_1: G$1; SymbolName_1: CRCW040210K0FKEDC; LibraryName: TTECH; DeviceSetName: RES_0402_VISHAY
R21 = RES_0402_VISHAY: RES SMD ... 0402; MANUFACTURER: VISHAY; MANUFACTURER_PART_NUMBER: CRCW040212K0FKEDC; PART_DESC: RES 12K OHM 1% 1/16W 0402; GateName_1: G$1; SymbolName_1: CRCW040210K0FKEDC; LibraryName: TTECH; DeviceSetName: RES_0402_VISHAY
R34 = RES_0402_VISHAY: RES SMD ... 0402; MANUFACTURER: VISHAY; MANUFACTURER_PART_NUMBER: CRCW0402200KFKED; PART_DESC: RES 200K OHM 1% 1/16W 0402; GateName_1: G$1; SymbolName_1: CRCW040210K0FKEDC; LibraryName: TTECH; DeviceSetName: RES_0402_VISHAY
R36 = RES_0402_VISHAY: RES SMD ... 0402; MANUFACTURER: VISHAY; MANUFACTURER_PART_NUMBER: CRCW04021K00FKEDC; PART_DESC: RES 1K OHM 1% 1/16W 0402; GateName_1: G$1; SymbolName_1: CRCW040210K0FKEDC; LibraryName: TTECH; DeviceSetName: RES_0402_VISHAY
R42 = RES_0402_VISHAY: RES SMD ... 0402; MANUFACTURER: VISHAY; MANUFACTURER_PART_NUMBER: CRCW0402100KFKEDC; PART_DESC: RES 100K OHM 1% 1/16W 0402; GateName_1: G$1; SymbolName_1: CRCW040210K0FKEDC; LibraryName: TTECH; DeviceSetName: RES_0402_VISHAY
U17 = PIC18F6627T-E/PT: GateName_1: A; SymbolName_1: PIC18F6627-X/PT; LibraryName: TTECH; DeviceSetName: PIC18F6627T-E/PT
U18 = MICROCHIP_MIC803-29D4VM3: PART_DESC: IC SUPERVISOR 1 CHANNEL SOT23-3; GateName_1: A; SymbolName_1: MIC803-29D4VM3; LibraryName: TTECH; DeviceSetName: MICROCHIP_MIC803-29D4VM3; GND: GND; COPYRIGHT: Copyright (C) 2022 Ultra Librarian. All rights reserved.
U19 = MICROCHIP_USB7002-I/KDX: GateName_1: A; SymbolName_1: USB7002-I/KDX_A; GateName_2: B; SymbolName_2: USB7002-I/KDX_B; LibraryName: TTECH; DeviceSetName: MICROCHIP_USB7002-I/KDX; A: A; COPYRIGHT: Copyright (C) 2022 Ultra Librarian. All rights reserved.
Y1 = CRYSTAL_OSC_ECS-2033-250-BN: subminiature SMD oscillators; PART_DESC: XTAL OSC XO 25.0000MHZ CMOS SMD; GateName_1: G$1; SymbolName_1: ECS-2033-250-BN; LibraryName: TTECH; DeviceSetName: CRYSTAL_OSC_ECS-2033-250-BN